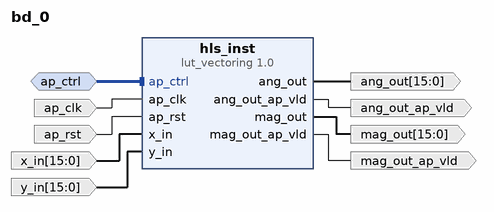
[diagram p0: block diagram of the top level]
# Vivado block design bd_0, xczu5eg-sfvc784-1-e, Vivado 2023.1
create_bd_design bd_0

create_bd_intf_port -mode Slave -vlnv xilinx.com:interface:acc_handshake_rtl:1.0 ap_ctrl
create_bd_port -dir O -from 15 -to 0 -type data ang_out
create_bd_port -dir O ang_out_ap_vld
create_bd_port -dir I -type clk ap_clk
set_property -dict {CONFIG.FREQ_HZ 100000000.0} [get_bd_ports ap_clk]
create_bd_port -dir I -type rst ap_rst
set_property -dict {CONFIG.POLARITY ACTIVE_HIGH} [get_bd_ports ap_rst]
create_bd_port -dir O -from 15 -to 0 -type data mag_out
create_bd_port -dir O mag_out_ap_vld
create_bd_port -dir I -from 15 -to 0 -type data x_in
create_bd_port -dir I -from 15 -to 0 -type data y_in

create_bd_cell -type ip -vlnv xilinx.com:hls:lut_vectoring:1.0 hls_inst

# ---- connections ----

connect_bd_intf_net -intf_net ap_ctrl_0_1 [get_bd_intf_ports ap_ctrl] [get_bd_intf_pins hls_inst/ap_ctrl]
connect_bd_net -net ap_clk_0_1 [get_bd_ports ap_clk] [get_bd_pins hls_inst/ap_clk]
connect_bd_net -net ap_rst_0_1 [get_bd_ports ap_rst] [get_bd_pins hls_inst/ap_rst]
connect_bd_net [get_bd_pins hls_inst/ang_out] [get_bd_ports ang_out]
connect_bd_net [get_bd_pins hls_inst/ang_out_ap_vld] [get_bd_ports ang_out_ap_vld]
connect_bd_net [get_bd_pins hls_inst/mag_out] [get_bd_ports mag_out]
connect_bd_net [get_bd_pins hls_inst/mag_out_ap_vld] [get_bd_ports mag_out_ap_vld]
connect_bd_net -net x_in_0_1 [get_bd_ports x_in] [get_bd_pins hls_inst/x_in]
connect_bd_net -net y_in_0_1 [get_bd_ports y_in] [get_bd_pins hls_inst/y_in]

validate_bd_design
save_bd_design
